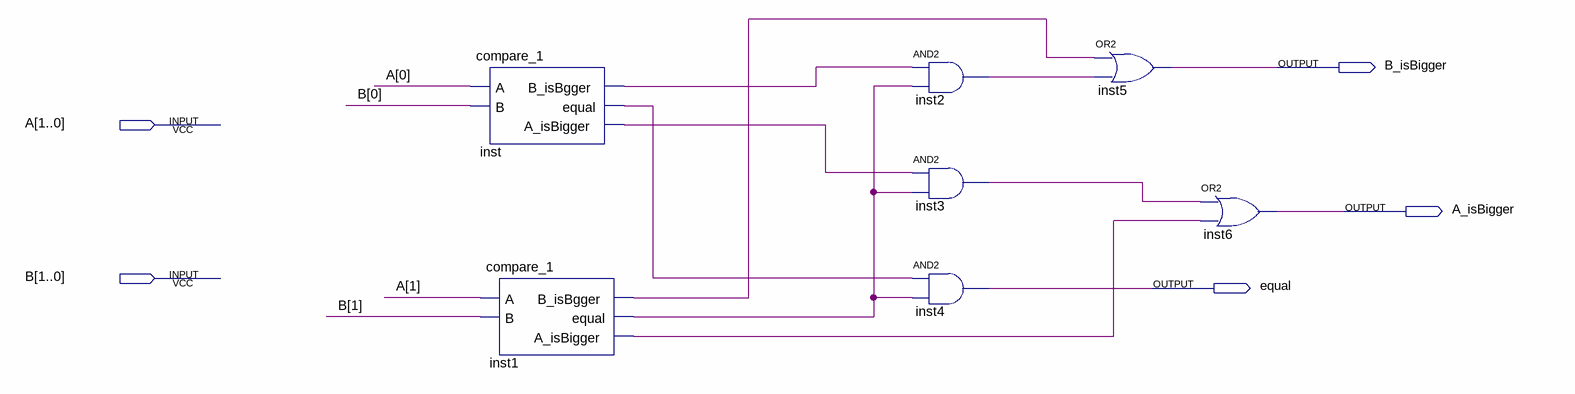
[diagram p0: schematic sheet]
// Quartus schematic compare_2.bdf as structural Verilog: 7 symbols, 5 pins
module compare_2 (
  input  [1:0] A,
  input  [1:0] B,
  output B_isBigger,
  output A_isBigger,
  output equal
);

  wire inst1_a_isbigger, inst1_b_isbgger, inst1_equal, inst2_out, inst3_out, inst_a_isbigger, inst_b_isbgger,
       inst_equal;

  compare_1 inst (.A(A[0]), .B(B[0]), .B_isBgger(inst_b_isbgger), .equal(inst_equal), .A_isBigger(inst_a_isbigger));
  compare_1 inst1 (.A(A[1]), .B(B[1]), .B_isBgger(inst1_b_isbgger), .equal(inst1_equal), .A_isBigger(inst1_a_isbigger));
  and inst2 (inst2_out, inst_b_isbgger, inst1_equal);
  and inst3 (inst3_out, inst_a_isbigger, inst1_equal);
  and inst4 (equal, inst_equal, inst1_equal);
  or inst5 (B_isBigger, inst1_b_isbgger, inst2_out);
  or inst6 (A_isBigger, inst3_out, inst1_a_isbigger);
endmodule
